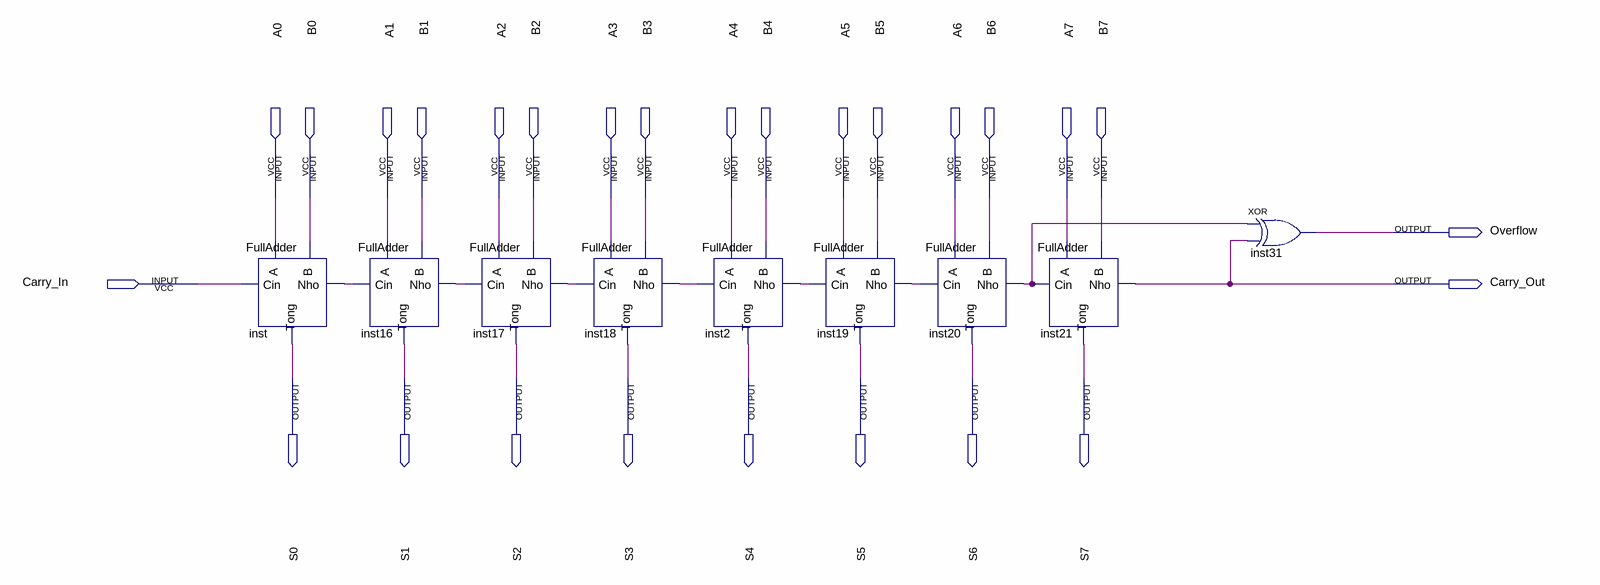
[diagram p0: schematic sheet]
// Quartus schematic FA_8bit.bdf as structural Verilog: 9 symbols, 27 pins
module FA_8bit (
  input  A0,
  input  B0,
  input  A1,
  input  B1,
  input  A2,
  input  B2,
  input  A3,
  input  B3,
  input  A4,
  input  B4,
  input  A5,
  input  B5,
  input  A6,
  input  B6,
  input  A7,
  input  B7,
  input  Carry_In,
  output Overflow,
  output Carry_Out,
  output S0,
  output S1,
  output S2,
  output S3,
  output S4,
  output S5,
  output S6,
  output S7
);

  wire inst2_nho, inst16_nho, inst17_nho, inst18_nho, inst19_nho, inst20_nho, inst_nho;

  FullAdder inst (.Cin(Carry_In), .A(A0), .B(B0), .Tong(S0), .Nho(inst_nho));
  FullAdder inst16 (.Cin(inst_nho), .A(A1), .B(B1), .Tong(S1), .Nho(inst16_nho));
  FullAdder inst17 (.Cin(inst16_nho), .A(A2), .B(B2), .Tong(S2), .Nho(inst17_nho));
  FullAdder inst18 (.Cin(inst17_nho), .A(A3), .B(B3), .Tong(S3), .Nho(inst18_nho));
  FullAdder inst2 (.Cin(inst18_nho), .A(A4), .B(B4), .Tong(S4), .Nho(inst2_nho));
  FullAdder inst19 (.Cin(inst2_nho), .A(A5), .B(B5), .Tong(S5), .Nho(inst19_nho));
  FullAdder inst20 (.Cin(inst19_nho), .A(A6), .B(B6), .Tong(S6), .Nho(inst20_nho));
  FullAdder inst21 (.Cin(inst20_nho), .A(A7), .B(B7), .Tong(S7), .Nho(Carry_Out));
  xor inst31 (Overflow, inst20_nho, Carry_Out);
endmodule
